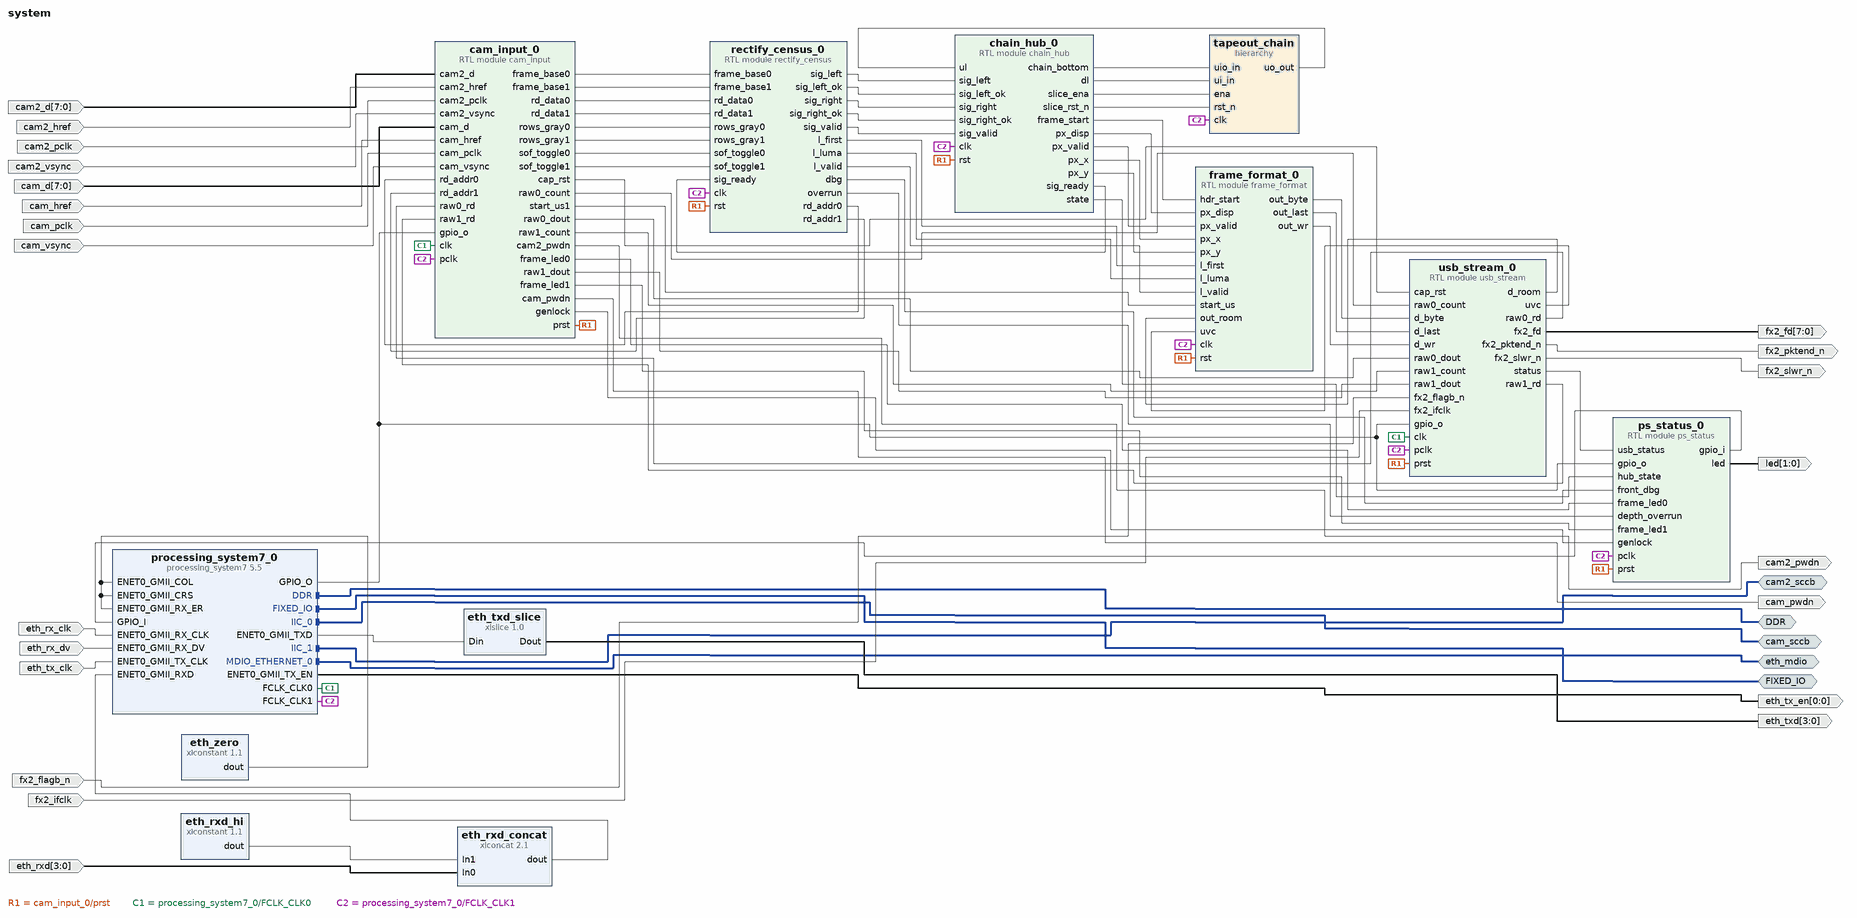
[diagram p0: block diagram of the top level]
# Vivado block design system, xc7z010clg400-1, Vivado 2025.2
create_bd_design system

create_bd_intf_port -mode Master -vlnv xilinx.com:interface:ddrx_rtl:1.0 DDR
create_bd_intf_port -mode Master -vlnv xilinx.com:display_processing_system7:fixedio_rtl:1.0 FIXED_IO
create_bd_intf_port -mode Master -vlnv xilinx.com:interface:iic_rtl:1.0 cam_sccb
create_bd_intf_port -mode Master -vlnv xilinx.com:interface:iic_rtl:1.0 cam2_sccb
create_bd_intf_port -mode Master -vlnv xilinx.com:interface:mdio_rtl:1.0 eth_mdio
create_bd_port -dir I -from 7 -to 0 cam_d
create_bd_port -dir I cam_pclk
create_bd_port -dir I cam_vsync
create_bd_port -dir I cam_href
create_bd_port -dir O cam_pwdn
create_bd_port -dir I -from 7 -to 0 cam2_d
create_bd_port -dir I cam2_pclk
create_bd_port -dir I cam2_vsync
create_bd_port -dir I cam2_href
create_bd_port -dir O cam2_pwdn
create_bd_port -dir I fx2_ifclk
create_bd_port -dir I fx2_flagb_n
create_bd_port -dir O -from 7 -to 0 fx2_fd
create_bd_port -dir O fx2_slwr_n
create_bd_port -dir O fx2_pktend_n
create_bd_port -dir O -from 1 -to 0 led
create_bd_port -dir I eth_rx_clk
create_bd_port -dir I -from 3 -to 0 eth_rxd
create_bd_port -dir I eth_rx_dv
create_bd_port -dir I eth_tx_clk
create_bd_port -dir O -from 0 -to 0 eth_tx_en
create_bd_port -dir O -from 3 -to 0 eth_txd

create_bd_cell -type ip -vlnv xilinx.com:ip:processing_system7:5.5 processing_system7_0
set_property -dict [list \
  CONFIG.PCW_ENET0_ENET0_IO EMIO \
  CONFIG.PCW_ENET0_GRP_MDIO_ENABLE 1 \
  CONFIG.PCW_ENET0_GRP_MDIO_IO EMIO \
  CONFIG.PCW_ENET0_PERIPHERAL_ENABLE 1 \
  CONFIG.PCW_ENET0_PERIPHERAL_FREQMHZ {100 Mbps} \
  CONFIG.PCW_ENET_RESET_ENABLE 0 \
  CONFIG.PCW_EN_CLK1_PORT 1 \
  CONFIG.PCW_FCLK_CLK1_BUF TRUE \
  CONFIG.PCW_FPGA0_PERIPHERAL_FREQMHZ 200 \
  CONFIG.PCW_FPGA1_PERIPHERAL_FREQMHZ 25 \
  CONFIG.PCW_FPGA_FCLK1_ENABLE 1 \
  CONFIG.PCW_GPIO_EMIO_GPIO_ENABLE 1 \
  CONFIG.PCW_GPIO_EMIO_GPIO_IO EMIO \
  CONFIG.PCW_GPIO_MIO_GPIO_ENABLE 1 \
  CONFIG.PCW_GPIO_MIO_GPIO_IO MIO \
  CONFIG.PCW_I2C0_I2C0_IO EMIO \
  CONFIG.PCW_I2C0_PERIPHERAL_ENABLE 1 \
  CONFIG.PCW_I2C1_I2C1_IO EMIO \
  CONFIG.PCW_I2C1_PERIPHERAL_ENABLE 1 \
  CONFIG.PCW_I2C_PERIPHERAL_FREQMHZ 111.111115 \
  CONFIG.PCW_I2C_RESET_ENABLE 0 \
  CONFIG.PCW_NAND_NAND_IO {MIO 0 2.. 14} \
  CONFIG.PCW_NAND_PERIPHERAL_ENABLE 1 \
  CONFIG.PCW_SD0_GRP_CD_ENABLE 0 \
  CONFIG.PCW_SD0_GRP_WP_ENABLE 0 \
  CONFIG.PCW_SD0_PERIPHERAL_ENABLE 1 \
  CONFIG.PCW_SD0_SD0_IO {MIO 40 .. 45} \
  CONFIG.PCW_SDIO_PERIPHERAL_FREQMHZ 100 \
  CONFIG.PCW_UART1_PERIPHERAL_ENABLE 1 \
  CONFIG.PCW_UART1_UART1_IO {MIO 24 .. 25} \
  CONFIG.PCW_UART_PERIPHERAL_FREQMHZ 100 \
  CONFIG.PCW_UIPARAM_DDR_BUS_WIDTH {16 Bit} \
  CONFIG.PCW_UIPARAM_DDR_PARTNO {MT41K128M16 JT-125} \
  CONFIG.PCW_USB_RESET_ENABLE 0 \
  CONFIG.PCW_USE_M_AXI_GP0 0 \
] [get_bd_cells processing_system7_0]
# 214 more settings of processing_system7_0 are not shown: defaults, MIO pin electricals, DDR timing, and values the tool derives
create_bd_cell -type module -reference cam_input cam_input_0
create_bd_cell -type module -reference rectify_census rectify_census_0
create_bd_cell -type module -reference chain_hub chain_hub_0
create_bd_cell -type module -reference frame_format frame_format_0
create_bd_cell -type module -reference usb_stream usb_stream_0
create_bd_cell -type module -reference ps_status ps_status_0
create_bd_cell -type hier tapeout_chain
create_bd_cell -type ip -vlnv xilinx.com:ip:xlconstant:1.1 eth_rxd_hi
set_property -dict {CONFIG.CONST_VAL 0 CONFIG.CONST_WIDTH 4} [get_bd_cells eth_rxd_hi]
create_bd_cell -type ip -vlnv xilinx.com:ip:xlconcat:2.1 eth_rxd_concat
set_property -dict {CONFIG.IN0_WIDTH 4 CONFIG.IN1_WIDTH 4 CONFIG.NUM_PORTS 2} [get_bd_cells eth_rxd_concat]
create_bd_cell -type ip -vlnv xilinx.com:ip:xlslice:1.0 eth_txd_slice
set_property -dict {CONFIG.DIN_FROM 3 CONFIG.DIN_TO 0 CONFIG.DIN_WIDTH 8 CONFIG.DOUT_WIDTH 4} [get_bd_cells eth_txd_slice]
create_bd_cell -type ip -vlnv xilinx.com:ip:xlconstant:1.1 eth_zero
set_property -dict {CONFIG.CONST_VAL 0 CONFIG.CONST_WIDTH 1} [get_bd_cells eth_zero]

# ---- hierarchy /tapeout_chain ----
current_bd_instance /tapeout_chain
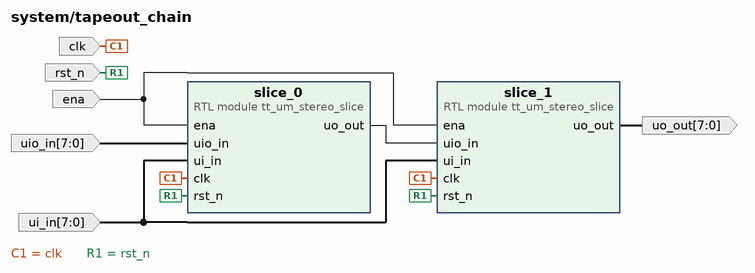
[diagram p1: block diagram inside /tapeout_chain]
create_bd_pin -dir I -type clk clk
create_bd_pin -dir I -from 7 -to 0 ui_in
create_bd_pin -dir I -type rst rst_n
create_bd_pin -dir I ena
create_bd_pin -dir I -from 7 -to 0 uio_in
create_bd_pin -dir O -from 7 -to 0 uo_out

create_bd_cell -type module -reference tt_um_stereo_slice slice_0
create_bd_cell -type module -reference tt_um_stereo_slice slice_1

# ---- connections ----

current_bd_instance /tapeout_chain
connect_bd_net [get_bd_pins clk] [get_bd_pins slice_0/clk] [get_bd_pins slice_1/clk]
connect_bd_net [get_bd_pins ena] [get_bd_pins slice_0/ena] [get_bd_pins slice_1/ena]
connect_bd_net [get_bd_pins rst_n] [get_bd_pins slice_0/rst_n] [get_bd_pins slice_1/rst_n]
connect_bd_net [get_bd_pins slice_0/uo_out] [get_bd_pins slice_1/uio_in]
connect_bd_net [get_bd_pins slice_1/uo_out] [get_bd_pins uo_out]
connect_bd_net [get_bd_pins ui_in] [get_bd_pins slice_0/ui_in] [get_bd_pins slice_1/ui_in]
connect_bd_net [get_bd_pins uio_in] [get_bd_pins slice_0/uio_in]

current_bd_instance /
connect_bd_intf_net [get_bd_intf_ports DDR] [get_bd_intf_pins processing_system7_0/DDR]
connect_bd_intf_net [get_bd_intf_ports FIXED_IO] [get_bd_intf_pins processing_system7_0/FIXED_IO]
connect_bd_intf_net [get_bd_intf_ports cam_sccb] [get_bd_intf_pins processing_system7_0/IIC_0]
connect_bd_intf_net [get_bd_intf_ports cam2_sccb] [get_bd_intf_pins processing_system7_0/IIC_1]
connect_bd_intf_net [get_bd_intf_ports eth_mdio] [get_bd_intf_pins processing_system7_0/MDIO_ETHERNET_0]
connect_bd_net [get_bd_ports cam2_d] [get_bd_pins cam_input_0/cam2_d]
connect_bd_net [get_bd_ports cam2_href] [get_bd_pins cam_input_0/cam2_href]
connect_bd_net [get_bd_ports cam2_pclk] [get_bd_pins cam_input_0/cam2_pclk]
connect_bd_net [get_bd_ports cam2_vsync] [get_bd_pins cam_input_0/cam2_vsync]
connect_bd_net [get_bd_ports cam_d] [get_bd_pins cam_input_0/cam_d]
connect_bd_net [get_bd_ports cam_href] [get_bd_pins cam_input_0/cam_href]
connect_bd_net [get_bd_pins cam_input_0/cam2_pwdn] [get_bd_ports cam2_pwdn]
connect_bd_net [get_bd_pins cam_input_0/cam_pwdn] [get_bd_ports cam_pwdn]
connect_bd_net [get_bd_pins cam_input_0/cap_rst] [get_bd_pins usb_stream_0/cap_rst]
connect_bd_net [get_bd_pins cam_input_0/frame_base0] [get_bd_pins rectify_census_0/frame_base0]
connect_bd_net [get_bd_pins cam_input_0/frame_base1] [get_bd_pins rectify_census_0/frame_base1]
connect_bd_net [get_bd_pins cam_input_0/frame_led0] [get_bd_pins ps_status_0/frame_led0]
connect_bd_net [get_bd_pins cam_input_0/frame_led1] [get_bd_pins ps_status_0/frame_led1]
connect_bd_net [get_bd_pins cam_input_0/genlock] [get_bd_pins ps_status_0/genlock]
connect_bd_net [get_bd_pins cam_input_0/prst] \
  [get_bd_pins rectify_census_0/rst] [get_bd_pins chain_hub_0/rst] [get_bd_pins frame_format_0/rst] \
  [get_bd_pins usb_stream_0/prst] [get_bd_pins ps_status_0/prst]
connect_bd_net [get_bd_pins cam_input_0/raw0_count] [get_bd_pins usb_stream_0/raw0_count]
connect_bd_net [get_bd_pins cam_input_0/raw0_dout] [get_bd_pins usb_stream_0/raw0_dout]
connect_bd_net [get_bd_pins cam_input_0/raw1_count] [get_bd_pins usb_stream_0/raw1_count]
connect_bd_net [get_bd_pins cam_input_0/raw1_dout] [get_bd_pins usb_stream_0/raw1_dout]
connect_bd_net [get_bd_pins cam_input_0/rd_data0] [get_bd_pins rectify_census_0/rd_data0]
connect_bd_net [get_bd_pins cam_input_0/rd_data1] [get_bd_pins rectify_census_0/rd_data1]
connect_bd_net [get_bd_pins cam_input_0/rows_gray0] [get_bd_pins rectify_census_0/rows_gray0]
connect_bd_net [get_bd_pins cam_input_0/rows_gray1] [get_bd_pins rectify_census_0/rows_gray1]
connect_bd_net [get_bd_pins cam_input_0/sof_toggle0] [get_bd_pins rectify_census_0/sof_toggle0]
connect_bd_net [get_bd_pins cam_input_0/sof_toggle1] [get_bd_pins rectify_census_0/sof_toggle1]
connect_bd_net [get_bd_pins cam_input_0/start_us1] [get_bd_pins frame_format_0/start_us]
connect_bd_net [get_bd_ports cam_pclk] [get_bd_pins cam_input_0/cam_pclk]
connect_bd_net [get_bd_ports cam_vsync] [get_bd_pins cam_input_0/cam_vsync]
connect_bd_net [get_bd_pins chain_hub_0/chain_bottom] [get_bd_pins tapeout_chain/uio_in]
connect_bd_net [get_bd_pins chain_hub_0/dl] [get_bd_pins tapeout_chain/ui_in]
connect_bd_net [get_bd_pins chain_hub_0/frame_start] [get_bd_pins frame_format_0/hdr_start]
connect_bd_net [get_bd_pins chain_hub_0/px_disp] [get_bd_pins frame_format_0/px_disp]
connect_bd_net [get_bd_pins chain_hub_0/px_valid] [get_bd_pins frame_format_0/px_valid]
connect_bd_net [get_bd_pins chain_hub_0/px_x] [get_bd_pins frame_format_0/px_x]
connect_bd_net [get_bd_pins chain_hub_0/px_y] [get_bd_pins frame_format_0/px_y]
connect_bd_net [get_bd_pins chain_hub_0/sig_ready] [get_bd_pins rectify_census_0/sig_ready]
connect_bd_net [get_bd_pins chain_hub_0/slice_ena] [get_bd_pins tapeout_chain/ena]
connect_bd_net [get_bd_pins chain_hub_0/slice_rst_n] [get_bd_pins tapeout_chain/rst_n]
connect_bd_net [get_bd_pins chain_hub_0/state] [get_bd_pins ps_status_0/hub_state]
connect_bd_net [get_bd_ports eth_rx_clk] [get_bd_pins processing_system7_0/ENET0_GMII_RX_CLK]
connect_bd_net [get_bd_ports eth_rx_dv] [get_bd_pins processing_system7_0/ENET0_GMII_RX_DV]
connect_bd_net [get_bd_ports eth_rxd] [get_bd_pins eth_rxd_concat/In0]
connect_bd_net [get_bd_pins eth_rxd_concat/dout] [get_bd_pins processing_system7_0/ENET0_GMII_RXD]
connect_bd_net [get_bd_pins eth_rxd_hi/dout] [get_bd_pins eth_rxd_concat/In1]
connect_bd_net [get_bd_ports eth_tx_clk] [get_bd_pins processing_system7_0/ENET0_GMII_TX_CLK]
connect_bd_net [get_bd_pins eth_txd_slice/Dout] [get_bd_ports eth_txd]
connect_bd_net [get_bd_pins eth_zero/dout] \
  [get_bd_pins processing_system7_0/ENET0_GMII_COL] [get_bd_pins processing_system7_0/ENET0_GMII_CRS] \
  [get_bd_pins processing_system7_0/ENET0_GMII_RX_ER]
connect_bd_net [get_bd_pins frame_format_0/out_byte] [get_bd_pins usb_stream_0/d_byte]
connect_bd_net [get_bd_pins frame_format_0/out_last] [get_bd_pins usb_stream_0/d_last]
connect_bd_net [get_bd_pins frame_format_0/out_wr] [get_bd_pins usb_stream_0/d_wr]
connect_bd_net [get_bd_ports fx2_flagb_n] [get_bd_pins usb_stream_0/fx2_flagb_n]
connect_bd_net [get_bd_ports fx2_ifclk] [get_bd_pins usb_stream_0/fx2_ifclk]
connect_bd_net [get_bd_pins processing_system7_0/ENET0_GMII_TXD] [get_bd_pins eth_txd_slice/Din]
connect_bd_net [get_bd_pins processing_system7_0/ENET0_GMII_TX_EN] [get_bd_ports eth_tx_en]
connect_bd_net [get_bd_pins processing_system7_0/FCLK_CLK0] [get_bd_pins cam_input_0/clk] [get_bd_pins usb_stream_0/clk]
connect_bd_net [get_bd_pins processing_system7_0/FCLK_CLK1] \
  [get_bd_pins cam_input_0/pclk] [get_bd_pins rectify_census_0/clk] [get_bd_pins chain_hub_0/clk] \
  [get_bd_pins frame_format_0/clk] [get_bd_pins usb_stream_0/pclk] [get_bd_pins ps_status_0/pclk] \
  [get_bd_pins tapeout_chain/clk]
connect_bd_net [get_bd_pins processing_system7_0/GPIO_O] \
  [get_bd_pins cam_input_0/gpio_o] [get_bd_pins usb_stream_0/gpio_o] [get_bd_pins ps_status_0/gpio_o]
connect_bd_net [get_bd_pins ps_status_0/gpio_i] [get_bd_pins processing_system7_0/GPIO_I]
connect_bd_net [get_bd_pins ps_status_0/led] [get_bd_ports led]
connect_bd_net [get_bd_pins rectify_census_0/dbg] [get_bd_pins ps_status_0/front_dbg]
connect_bd_net [get_bd_pins rectify_census_0/l_first] [get_bd_pins frame_format_0/l_first]
connect_bd_net [get_bd_pins rectify_census_0/l_luma] [get_bd_pins frame_format_0/l_luma]
connect_bd_net [get_bd_pins rectify_census_0/l_valid] [get_bd_pins frame_format_0/l_valid]
connect_bd_net [get_bd_pins rectify_census_0/overrun] [get_bd_pins ps_status_0/depth_overrun]
connect_bd_net [get_bd_pins rectify_census_0/rd_addr0] [get_bd_pins cam_input_0/rd_addr0]
connect_bd_net [get_bd_pins rectify_census_0/rd_addr1] [get_bd_pins cam_input_0/rd_addr1]
connect_bd_net [get_bd_pins rectify_census_0/sig_left] [get_bd_pins chain_hub_0/sig_left]
connect_bd_net [get_bd_pins rectify_census_0/sig_left_ok] [get_bd_pins chain_hub_0/sig_left_ok]
connect_bd_net [get_bd_pins rectify_census_0/sig_right] [get_bd_pins chain_hub_0/sig_right]
connect_bd_net [get_bd_pins rectify_census_0/sig_right_ok] [get_bd_pins chain_hub_0/sig_right_ok]
connect_bd_net [get_bd_pins rectify_census_0/sig_valid] [get_bd_pins chain_hub_0/sig_valid]
connect_bd_net [get_bd_pins tapeout_chain/uo_out] [get_bd_pins chain_hub_0/ul]
connect_bd_net [get_bd_pins usb_stream_0/d_room] [get_bd_pins frame_format_0/out_room]
connect_bd_net [get_bd_pins usb_stream_0/fx2_fd] [get_bd_ports fx2_fd]
connect_bd_net [get_bd_pins usb_stream_0/fx2_pktend_n] [get_bd_ports fx2_pktend_n]
connect_bd_net [get_bd_pins usb_stream_0/fx2_slwr_n] [get_bd_ports fx2_slwr_n]
connect_bd_net [get_bd_pins usb_stream_0/raw0_rd] [get_bd_pins cam_input_0/raw0_rd]
connect_bd_net [get_bd_pins usb_stream_0/raw1_rd] [get_bd_pins cam_input_0/raw1_rd]
connect_bd_net [get_bd_pins usb_stream_0/status] [get_bd_pins ps_status_0/usb_status]
connect_bd_net [get_bd_pins usb_stream_0/uvc] [get_bd_pins frame_format_0/uvc]

set_property USER_COMMENTS.comment_0 {tapeout_chain: 2 x tt_um_stereo_slice, the Tiny Tapeout module (asic/tt). 16 disparities per slice; chain_hub_0 broadcasts the census signatures (dl), the result travels from slice to slice (uo_out -> uio_in) and back to the hub (ul).} [current_bd_design]

validate_bd_design
save_bd_design
